# Altium schematic sheet Pulse Generation.SchDoc
size A4; SheetNumber: 2; SheetTotal: 3
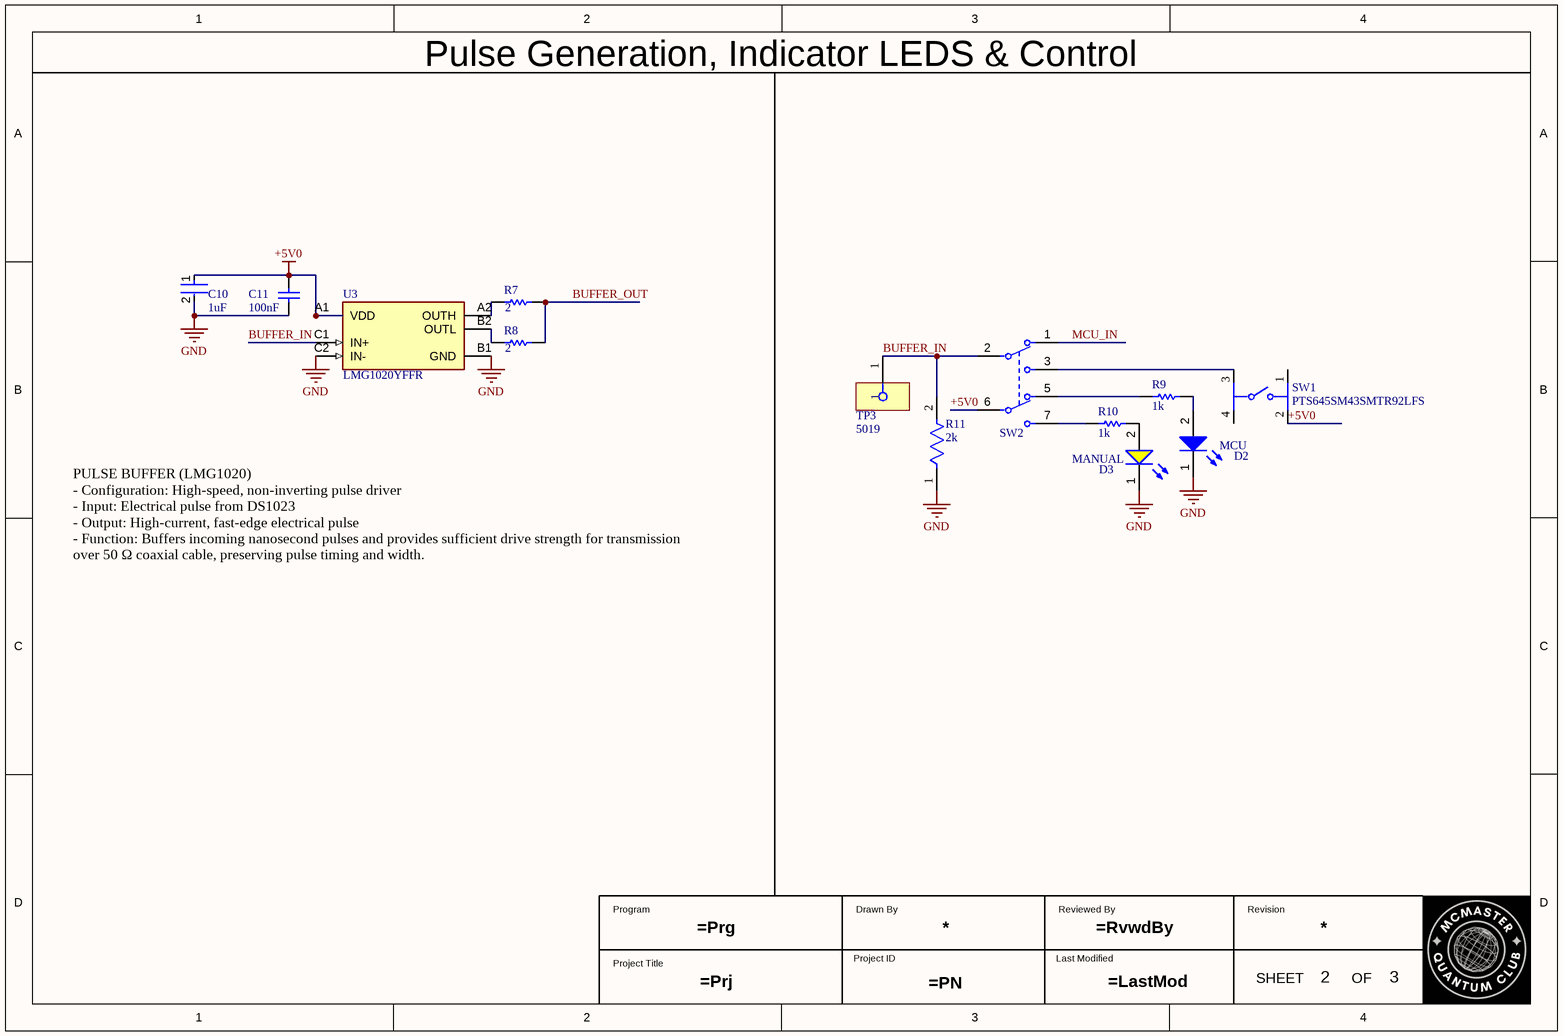
[diagram p0: Pulse Generation.SchDoc]

## Parts
C10  1uF  [FP-1206-L_3_2_0_15-W_1_6-IPC_A]
C11  100nF  [CAPC2013X145X50LL20T20]
D2  MCU  [WL-SMCW_0805_150080xx75000]
D3  MANUAL  [WL-SMCW_0805_150080xx75000]
R7  2  [RESC1005X40X25NL05T10]
R8  2  [RESC1005X40X25NL05T10]
R9  1k  [RESC2013X60X35ML10T20]
R10  1k  [RESC2013X60X35ML10T20]
R11  2k  [FP-TFCR1206-IPC_B]
SW1  PTS645SM43SMTR92LFS  [PTS645SM43SMTR92LFS_MFG]
SW2  JS202011JCQN  [FP-JS202011JCQN-MFG]  (value not drawn)
TP3  5019  [5019_MFG]
U3  LMG1020YFFR  [FP-YFF0006-MFG]

## Nets
+5V0: C10.1 C11.2 SW1.2 SW2.6(2_C) U3.A1(VDD)
GND: C10.2 C11.1 D2.1(K) D3.1(K) R11.1 U3.B1(GND) U3.C2(IN-)
BUFFER_IN: R11.2 SW2.2(1_C) TP3.1 U3.C1(IN+)
BUFFER_OUT: R7.2 R8.2
MCU_IN: SW2.1
NetD2_2: D2.2(A) R9.2
NetD3_2: D3.2(A) R10.2
NetR7_1: R7.1 U3.A2(OUTH)
NetR8_1: R8.1 U3.B2(OUTL)
NetR9_1: R9.1 SW2.5
NetR10_1: R10.1 SW2.7
NetSW1_3: SW1.3 SW2.3

Not connected (* = marked no-connect by the designer): SW1 1 4

## Notes on the sheet
- Pulse Generation, Indicator LEDS & Control
- PULSE BUFFER (LMG1020)
  - Configuration: High-speed, non-inverting pulse driver
  - Input: Electrical pulse from DS1023
  - Output: High-current, fast-edge electrical pulse
  - Function: Buffers incoming nanosecond pulses and provides sufficient drive strength for transmission over 50 Ω coaxial cable, preserving pulse timing and width.
- Program
- Drawn By
- Reviewed By
- Revision
- Project Title
- Project ID
- Last Modified
- SHEET
- OF

## Library data of the parts
C10 = CMP-14477-003123-2: None
C11 = CMP-2007-01396-1: Part Number: VJ0805Y104JXXPW1BC; Manufacturer: Vitramon
D2 = CMP-1426-00008-9: Wurth Elektronik Blue LED, WL-SMCW Series, 0805 (2012), 470nm, 2x1.25x0.7mm; Manufacturer Lifecycle Status: ACTIVE; Manufacturer Package Identifier: 0805 (2012 metric); YEOL: 1 = Estimated lifetime > 10 years; Peak Wavelength: 465nm; Reverse Voltage: 5V; Lens Style: Clear, Rectangular; Luminous Intensity: 145mcd; Power Dissipation: 105mW; Test Current: 20mA; Viewing Angle: 140°; Forward Voltage: 3.2V; Max Junction Temperature (Tj): 95°C; Forward Current: 100mA; Length: 2mm; Width: 1.25mm; Min Operating Temperature: -40°C; Color: Blue; Packaging: Tape and Reel; Lifecycle Status: Production; Height: 700µm; REACH SVHC: Unknown; Case Code (Imperial): 0805; Mount: Surface Mount; Dominant Wavelength: 470nm; Wavelength: 470nm; Lead Free: Lead Free; Case/Package: 0805; Max Reverse Voltage (DC): 5V; Case Code (Metric): 2012; RoHS: Compliant; Max Operating Temperature: 85°C
D3 = CMP-1426-00012-5: 2 V Yellow LED 2012 (0805) SMD, Wurth Elektronik WL-SMCW 150080YS75000; Manufacturer Lifecycle Status: ACTIVE; Manufacturer Package Identifier: 0805 (2012 metric); YEOL: 1 = Estimated lifetime > 10 years; Dominant Wavelength: 590nm; Forward Voltage: 2V; Forward Current: 100mA; Test Current: 20mA; Max Junction Temperature (Tj): 95°C; Reverse Voltage: 5V; Viewing Angle: 140°; Lens Style: Clear, Rectangular; Peak Wavelength: 595nm; Power Dissipation: 72mW; Luminous Intensity: 120mcd; REACH SVHC: Unknown; Width: 1.25mm; Height: 700µm; RoHS: Compliant; Wavelength: 590nm; Length: 2mm; Mount: Surface Mount; Max Operating Temperature: 85°C; Min Operating Temperature: -40°C; Case Code (Imperial): 0805; Case Code (Metric): 2012; Max Reverse Voltage (DC): 5V; Packaging: Tape and Reel; Color: Yellow; Lifecycle Status: Production; Case/Package: 0805
R7 R8 = CMP-2002-07592-1: Manufacturer: Yageo; Part Number: RC0402FR-072R15L
R9 R10 = CMP-2100-03671-1: Chip Resistor, 1 KOhm, +/- 1%, 125 mW, -55 to 155 degC, 0805 (2012 Metric), RoHS, Tape and Reel; Manufacturer: Yageo; Temperature Coefficient: 100ppm/degreesC; Voltage Rating (DC): 150V; Max Power Dissipation: 125mW; Resistance: 1KOhm; Number of Pins: 2; Number of Terminations: 2; Datasheet URL: http://www.yageo.com/NewPortal/yageodocoutput?fileName=/pdf/R-Chip/PYu-RC_Group_51_RoHS_L_5.pdf; Length: 0.079inch; Package Description: 2-Pin Surface Mounted Device, Body 2 x 1.25 mm; Depth: 1.25mm; Height: 0.024inch; Military Standard: Not; Case/Package: 0805; Package Reference: 0805; RoHSCompliant: true; Lead Free: LeadFree; Packaging: TapeandReel; Package Quantity: 1; Datasheet Version: Rev. 5, 10/2016; Tolerance: 1%; Min Operating Temperature: -55degC; Voltage Rating: 150V; Composition: ThickFilm; Case Code (Imperial): 0805; Power Rating: 125mW; Width: 0.049inch; Case Code (Metric): 2012; Manufacturer URL: http://www.yageo.com/; Max Operating Temperature: 155degC; REACH SVHC: Unknown; Termination: SMD/SMT
R11 = CMP-250906-277321-1: RES Thin Film, 2kΩ, 0.1%, 0.25W, 25ppm/°C, 1206
SW1 = CMP-2000-05160-3: Switch Tactile N.O SPST Round Button Gull Wing 0.05A 12VDC 100000Cycle 1.57N SMD T/R; Switch Function: Off-Mom; Life (Cycles): 100kcycles; Voltage Rating (DC): 12V; Actuator Material: Nylon, Polyamide; Max Current Rating: 50mA; Contact Resistance: 100mΩ; Number of Positions: 1; Actuator Length: 850µm; Illumination Type: Illuminated, Non-Illuminated; Insulation Resistance: 100GΩ; RoHS: Compliant; Electrical Life: 100kcycles; Lead Free: Lead Free; Contact Plating: Silver; Case/Package: SMD/SMT; Termination: Solder; Height: 3.45mm; Manufacturer Package Identifier: PTS645SM43SMTR92LFS; ComponentLink1URL: http://www.ck-components.com/; Max Voltage Rating (DC): 12V; Lifecycle Status: Production; Min Operating Temperature: -20°C; Throw Configuration: SPST; China RoHS: Compliant; ComponentLink1Description: Manufacturer's Website; Operating Force: 1.57N; Depth: 9mm; Contact Material: Silver; Length: 6mm; Current Rating: 50mA; Color: Black; Contact Current Rating: 50mA; Mechanical Life: 100kcycles; ComponentLink2URL: https://www.ckswitches.com/media/1471/pts645.pdf; Orientation: Straight; Packaging: Cut Tape (CT); REACH SVHC: Yes; Max Operating Temperature: 60°C; ComponentLink2Description: Datasheet URL; HelpURL: https://www.ckswitches.com/media/1471/pts645.pdf; Mount: Surface Mount
SW2 = CMP-10038-000009-1: SWITCH SLIDE DPDT 300MA 6V; Actuator Material: Nylon; Actuator Length: 2mm; Actuator Type: Standard; Electrical Life: 5000Cycles; Switch Function: On-On; Mount: Surface Mount; Current Rating: 300mA; Contact Material: Copper Alloy; Voltage Rating (DC): 6V; Throw Configuration: DPDT; Packaging: Cut Tape; Contact Plating: Silver; Min Operating Temperature: -40°C; Switch Travel: 2mm; Max Operating Temperature: 85°C
TP3 = CMP-1672-00008-3: Phosphor Bronze Contact Miniature Silver Plated Surface Mount Test Points; Number of Contacts: 1; ComponentLink1Description: Manufacturer's Website; Number of Pins: 1; Height: 2.42mm; Mount: Surface Mount; HelpURL: https://www.keyelco.com/product-pdf.cfm?p=1357; REACH SVHC: Yes; Packaging: Tape and Reel; Lead Free: Lead Free; ComponentLink1URL: http://www.keyelco.com/; Termination: SMD/SMT; Material: Bronze; Contact Plating: Silver; Contact Material: Silver; RoHS: Compliant; ComponentLink2URL: https://www.keyelco.com/product-pdf.cfm?p=1357; China RoHS: Compliant; Lifecycle Status: Production; ComponentLink2Description: Datasheet URL
U3 = CMP-04912-000016-1: IC GATE DRVR LOW-SIDE 6DSBGA; Manufacturer: Texas Instruments; Fall Time: 400ps; Number Of Outputs: 1; Min Supply Voltage: 4.75V; Standoff Height: 0.12mm; Nominal Supply Current: 40-51mA; Max Supply Voltage: 5.4V; Output Current: 7A; Max Junction Temp: +125°C; Propagation Delay: 2.5ns; Category: IC; Rise Time: 400ps; Temperature: -40°C to +125°C; Number Of Drivers: 1; RoHS: TRUE; Lead Free: Yes; ComponentLink2URL: http://www.ti.com/lit/ds/symlink/lmg1020.pdf; Mouser Description: 5V, 7A/5A low side GaN driver with 60MHz/1ns speed 6-DSBGA -40 to 125; Temperature Range Low: -40°C; Device Class L1: Integrated Circuits (ICs); Device Class L3: Gate Drivers; Automotive: No; Manufacturer Part Number: LMG1020YFFR; Device Class L2: Power Management ICs; Height: 0.625mm; Temperature Range High: +125°C; Octopart: https://octopart.com/lmg1020yffr-texas+instruments-89917478; Ipc Land Pattern Name: BGA6N40P2X3_125X85X62; ComponentLink2Description: Datasheet; Package: YFF0006; Digikey Description: IC GATE DRVR LOW-SIDE 6DSBGA